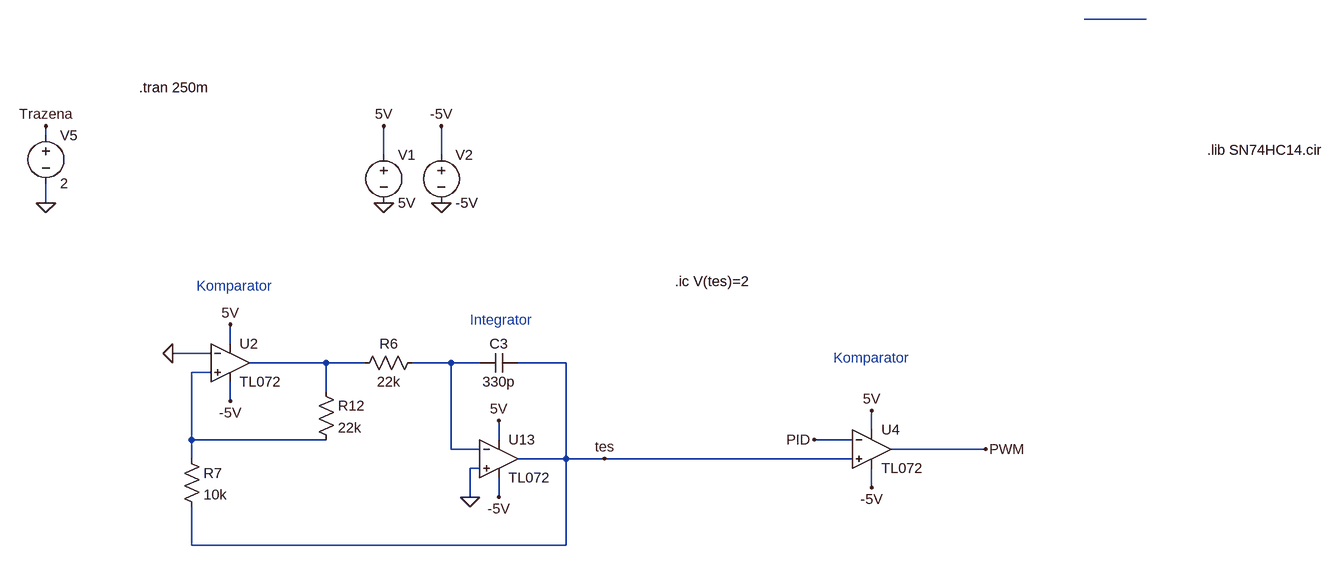
[diagram p0: schematic saw_gen_2.asc]
saw_gen_2.asc, the LTspice schematic file:
Version 4
SHEET 1 6380 2180
WIRE 2128 -960 1936 -960
WIRE -1392 -624 -1392 -640
WIRE -272 -592 -272 -640
WIRE -176 -592 -176 -640
WIRE -1392 -512 -1392 -544
WIRE -528 -192 -528 -224
WIRE -560 -176 -624 -176
WIRE -368 -160 -496 -160
WIRE -304 -160 -368 -160
WIRE -160 -160 -224 -160
WIRE -112 -160 -160 -160
WIRE 32 -160 -48 -160
WIRE -560 -144 -592 -144
WIRE -368 -112 -368 -160
WIRE -528 -96 -528 -128
WIRE 608 -48 608 -80
WIRE -592 -32 -592 -144
WIRE -368 -32 -592 -32
WIRE -80 -32 -80 -64
WIRE 576 -32 512 -32
WIRE -160 -16 -160 -160
WIRE -112 -16 -160 -16
WIRE 880 -16 640 -16
WIRE -592 0 -592 -32
WIRE 32 0 32 -160
WIRE 32 0 -48 0
WIRE 96 0 32 0
WIRE 576 0 96 0
WIRE -112 16 -128 16
WIRE 608 48 608 16
WIRE -128 64 -128 16
WIRE -80 64 -80 32
WIRE -592 144 -592 80
WIRE 32 144 32 0
WIRE 32 144 -592 144
FLAG -272 -512 0
FLAG -272 -640 5V
FLAG -176 -512 0
FLAG -176 -640 -5V
FLAG 512 -32 PID
FLAG 880 -16 PWM
FLAG -1392 -512 0
FLAG -1392 -640 Trazena
FLAG -128 64 0
FLAG -624 -176 0
FLAG -528 -96 -5V
FLAG -528 -224 5V
FLAG -80 -64 5V
FLAG -80 64 -5V
FLAG 96 0 tes
FLAG 608 -80 5V
FLAG 608 48 -5V
SYMBOL voltage -272 -608 R0
WINDOW 123 0 0 Left 0
WINDOW 39 0 0 Left 0
SYMATTR InstName V1
SYMATTR Value 5V
SYMBOL voltage -176 -608 R0
WINDOW 123 0 0 Left 0
WINDOW 39 0 0 Left 0
SYMATTR InstName V2
SYMATTR Value -5V
SYMBOL voltage -1392 -640 R0
WINDOW 123 0 0 Left 0
WINDOW 39 0 0 Left 0
SYMATTR InstName V5
SYMATTR Value 2
SYMBOL res -208 -176 R90
WINDOW 0 0 56 VBottom 2
WINDOW 3 32 56 VTop 2
SYMATTR InstName R6
SYMATTR Value 22k
SYMBOL cap -48 -176 R90
WINDOW 0 0 32 VBottom 2
WINDOW 3 32 32 VTop 2
SYMATTR InstName C3
SYMATTR Value 330p
SYMBOL res -608 -16 R0
SYMATTR InstName R7
SYMATTR Value 10k
SYMBOL res -384 -128 R0
SYMATTR InstName R12
SYMATTR Value 22k
SYMBOL ZZZ\\OpAmp\\TL072 -528 -160 R0
SYMATTR InstName U2
SYMBOL ZZZ\\OpAmp\\TL072 -80 0 R0
SYMATTR InstName U13
SYMBOL ZZZ\\OpAmp\\TL072 608 -16 R0
SYMATTR InstName U4
TEXT -680 -704 Left 2 !.tran 250m
TEXT 544 -168 Left 2 ;Komparator
TEXT 280 -296 Left 2 !.ic V(tes)=2
TEXT -128 -232 Left 2 ;Integrator
TEXT -584 -288 Left 2 ;Komparator
TEXT 2328 -600 Left 2 !.lib SN74HC14.cir

The netlist it stands for:
* saw_gen_2.asc
V1 5V 0 5V
V2 -5V 0 -5V
V5 Trazena 0 2
R6 N003 N002 22k
C3 tes N003 330p
R7 N004 tes 10k
R12 N002 N004 22k
* U2: TL072 (symbol ZZZ\OpAmp\TL072 not available, pins judged from their places): In+=N004 In-=0 V+=5V V-=-5V OUT=N002
* U13: TL072 (symbol ZZZ\OpAmp\TL072 not available, pins judged from their places): In+=0 In-=N003 V+=5V V-=-5V OUT=tes
* U4: TL072 (symbol ZZZ\OpAmp\TL072 not available, pins judged from their places): In+=tes In-=PID V+=5V V-=-5V OUT=PWM
.tran 250m
* Komparator
.ic V(tes)=2
* Integrator
* Komparator
.lib SN74HC14.cir
.backanno
.end